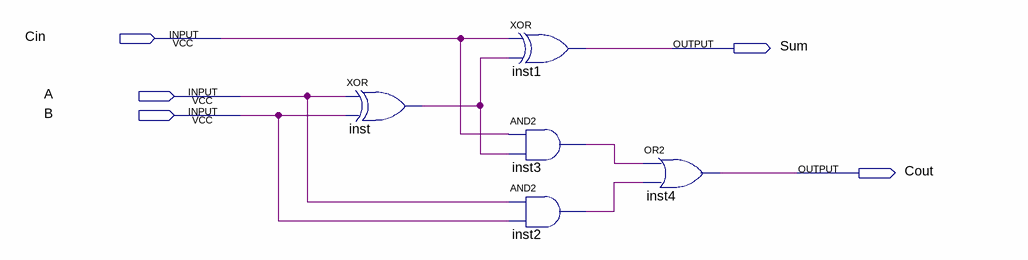
[diagram p0: schematic sheet]
// Quartus schematic FullAdder.bdf as structural Verilog: 5 symbols, 5 pins
module FullAdder (
  input  Cin,
  input  A,
  input  B,
  output Sum,
  output Cout
);

  wire inst2_out, inst3_out, inst_out;

  xor inst (inst_out, A, B);
  xor inst1 (Sum, Cin, inst_out);
  and inst3 (inst3_out, Cin, inst_out);
  and inst2 (inst2_out, A, B);
  or inst4 (Cout, inst3_out, inst2_out);
endmodule
